# Altium project NewTrackerLED.PrjPcb
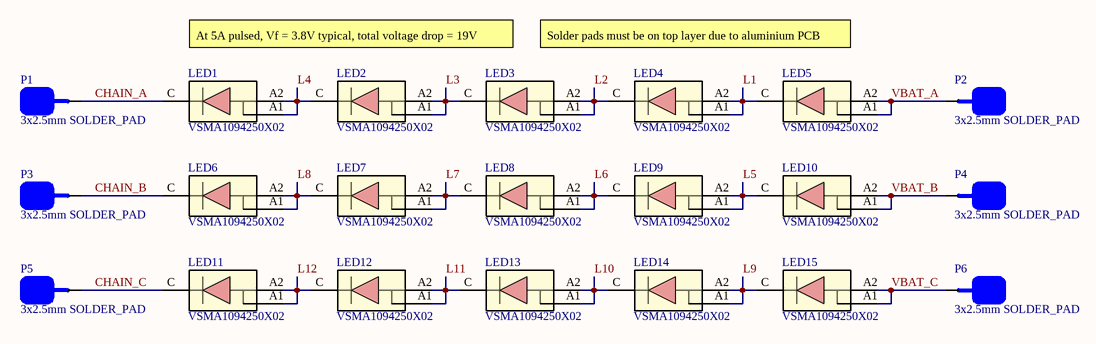
[diagram p0: Sheet2.SchDoc]
1 sheet, 21 parts. Net scope: global (net labels, ports and power ports of the same name join across sheets).
Board file: NewTrackerIRLED.PcbDoc

## Sheet Sheet2.SchDoc
size A4; SheetNumber: 1; SheetTotal: 1

### Parts
LED1  VSMA1094250X02  [DIODE_VSMA1085400_VIS]
LED2  VSMA1094250X02  [DIODE_VSMA1085400_VIS]
LED3  VSMA1094250X02  [DIODE_VSMA1085400_VIS]
LED4  VSMA1094250X02  [DIODE_VSMA1085400_VIS]
LED5  VSMA1094250X02  [DIODE_VSMA1085400_VIS]
LED6  VSMA1094250X02  [DIODE_VSMA1085400_VIS]
LED7  VSMA1094250X02  [DIODE_VSMA1085400_VIS]
LED8  VSMA1094250X02  [DIODE_VSMA1085400_VIS]
LED9  VSMA1094250X02  [DIODE_VSMA1085400_VIS]
LED10  VSMA1094250X02  [DIODE_VSMA1085400_VIS]
LED11  VSMA1094250X02  [DIODE_VSMA1085400_VIS]
LED12  VSMA1094250X02  [DIODE_VSMA1085400_VIS]
LED13  VSMA1094250X02  [DIODE_VSMA1085400_VIS]
LED14  VSMA1094250X02  [DIODE_VSMA1085400_VIS]
LED15  VSMA1094250X02  [DIODE_VSMA1085400_VIS]
P1  3x2.5mm SOLDER_PAD  [SOLDER_PAD_SMD]
P2  3x2.5mm SOLDER_PAD  [SOLDER_PAD_SMD]
P3  3x2.5mm SOLDER_PAD  [SOLDER_PAD_SMD]
P4  3x2.5mm SOLDER_PAD  [SOLDER_PAD_SMD]
P5  3x2.5mm SOLDER_PAD  [SOLDER_PAD_SMD]
P6  3x2.5mm SOLDER_PAD  [SOLDER_PAD_SMD]

### Nets
CHAIN_A: LED1.C P1.1
CHAIN_B: LED6.C P3.1
CHAIN_C: LED11.C P5.1
L1: LED4.A1 LED4.A2 LED5.C
L2: LED3.A1 LED3.A2 LED4.C
L3: LED2.A1 LED2.A2 LED3.C
L4: LED1.A1 LED1.A2 LED2.C
L5: LED9.A1 LED9.A2 LED10.C
L6: LED8.A1 LED8.A2 LED9.C
L7: LED7.A1 LED7.A2 LED8.C
L8: LED6.A1 LED6.A2 LED7.C
L9: LED14.A1 LED14.A2 LED15.C
L10: LED13.A1 LED13.A2 LED14.C
L11: LED12.A1 LED12.A2 LED13.C
L12: LED11.A1 LED11.A2 LED12.C
VBAT_A: LED5.A1 LED5.A2 P2.1
VBAT_B: LED10.A1 LED10.A2 P4.1
VBAT_C: LED15.A1 LED15.A2 P6.1

### Notes on the sheet
- At 5A pulsed, Vf = 3.8V typical, total voltage drop = 19V
- Solder pads must be on top layer due to aluminium PCB

### Library data of the parts
LED1-LED15 = VSMA1094250X02: Infrared Emitters - High Power HIPOW IR EMITTING DIODE 940NM -E3; Manufacturer: Vishay; Viewing Angle: 28°; Supplier 1: DigiKey; Manufacturer Part Number: VSMA1094250X02; RoHS: Compliant; Category: Optoelectronics; Stock 1: 362; Pricing 1: 1=3.36, 10=2.456, 100=1.9169 (USD); Country of Origin: Mainland China; Harmonized Tariff Schedule (HTS) Code: 8541.40.20.00; Introduction Date: 2024-04-30; Lifecycle Status: Production; Wavelength: 940nm; ComponentLink1URL: https://datasheet.octopart.com:443/VSMA1094250X02-Vishay-datasheet-177116671.pdf?src-supplier=Future+Electronics; ComponentLink1Description: https://datasheet.octopart.com:443/VSMA1094250X02-Vishay-datasheet-177116671.pdf?src-supplier=Future+Electronics; ComponentLink2URL: http://sigma.octopart.com:80/rohs_statement/Vishay-company-15.pdf?src-supplier=Compliance+Statements; ComponentLink2Description: http://sigma.octopart.com:80/rohs_statement/Vishay-company-15.pdf?src-supplier=Compliance+Statements; Supplier Part Number 1: 751-VSMA1094250X02CT-ND
P1-P6 = 3x2.5mm SMD_SOLDER_PAD: Plated SMD 3x2.5mm SOLDER_PAD